# Altium schematic sheet RS485.SchDoc: RS485 Transceiver
size A4; ApprovedBy: LD Stanton; Author: LD Stanton; CompanyName: University of Cape Town; DrawnBy: Lawrence Stanton; Engineer: Lawrence Stanton; Organization: University of Cape Town; Address1: Department of Electrical Engineering; Address2: Rondebosch; Address3: Cape Town; Address4: South Africa 7701; DocumentNumber: 7; SheetNumber: 7; SheetTotal: 14
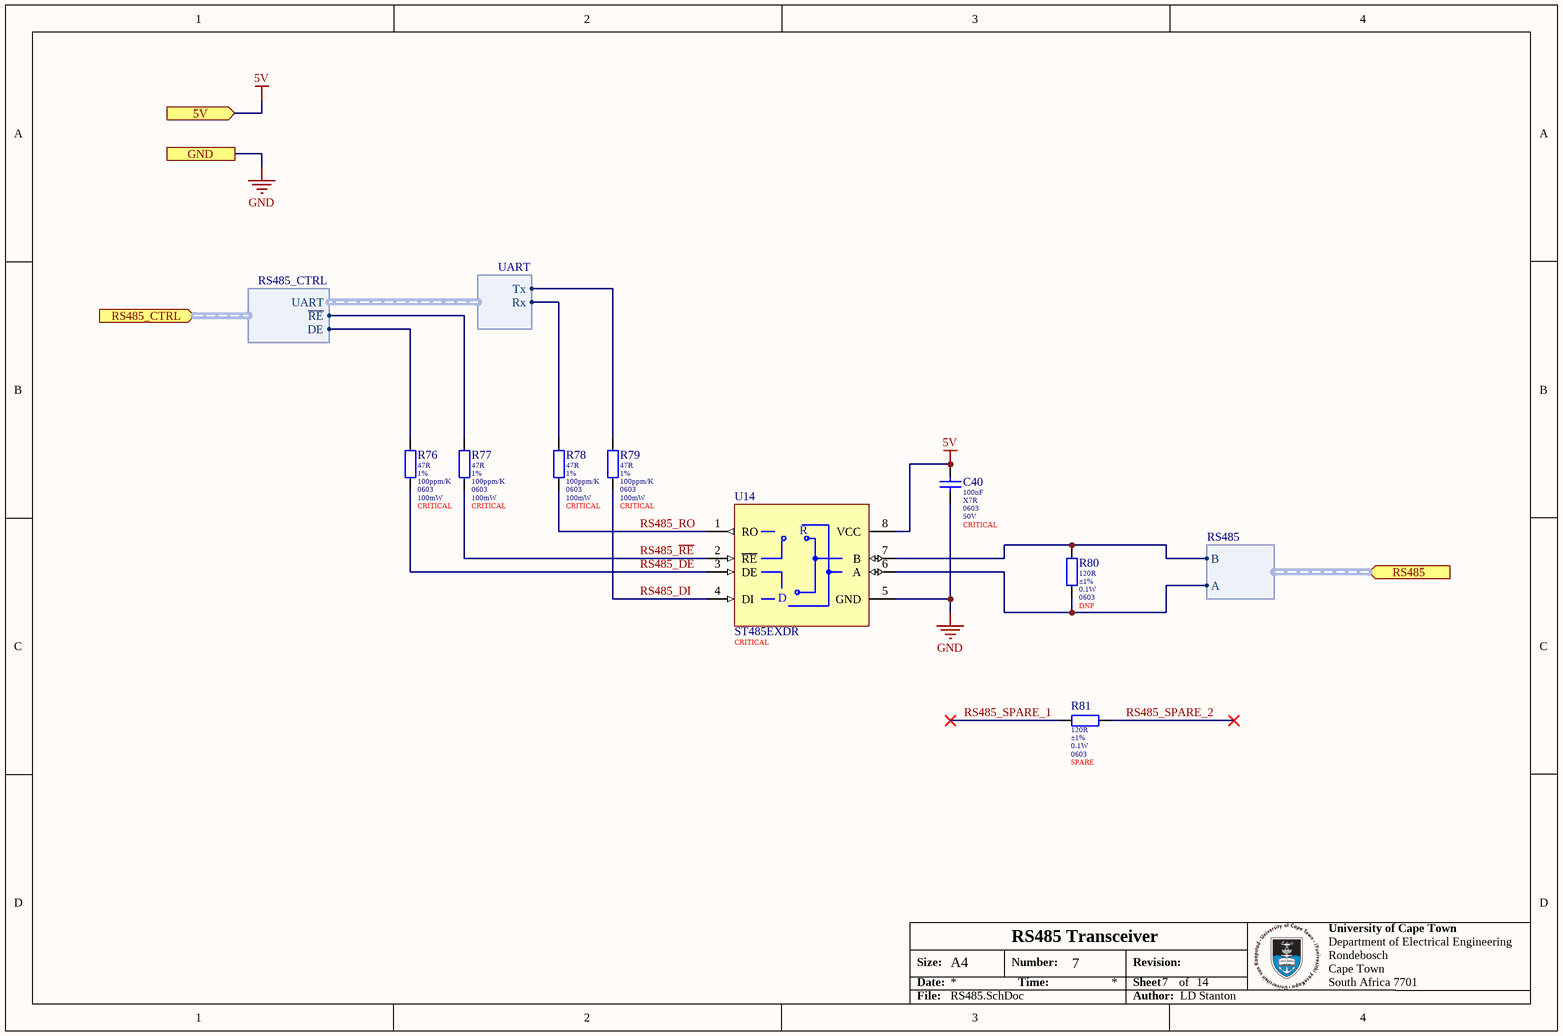
[diagram p0: RS485.SchDoc]

## Parts
C40  value 100nF  Dielectric: X7R  Package: 0603  Voltage: 50V  Populate: CRITICAL  [0603 (Yageo DA) B]  (hidden comment: CC0603KRX7R9BB104)
R76  value 47R  Tolerance: 1%  Temperature Coefficient: 100ppm/K  Package: 0603  Power: 100mW  Populate: CRITICAL  [0603 (Uniroyal) B]  (hidden comment: 0603WAF470JT5E)
R77  value 47R  Tolerance: 1%  Temperature Coefficient: 100ppm/K  Package: 0603  Power: 100mW  Populate: CRITICAL  [0603 (Uniroyal) B]  (hidden comment: 0603WAF470JT5E)
R78  value 47R  Tolerance: 1%  Temperature Coefficient: 100ppm/K  Package: 0603  Power: 100mW  Populate: CRITICAL  [0603 (Uniroyal) B]  (hidden comment: 0603WAF470JT5E)
R79  value 47R  Tolerance: 1%  Temperature Coefficient: 100ppm/K  Package: 0603  Power: 100mW  Populate: CRITICAL  [0603 (Uniroyal) B]  (hidden comment: 0603WAF470JT5E)
R80  value 120R  Tolerance: ±1%  Power: 0.1W  Package: 0603  Populate: DNP  [0603 (Uniroyal) B]  (hidden comment: 0603WAF1200T5E)
R81  value 120R  Tolerance: ±1%  Power: 0.1W  Package: 0603  Populate: SPARE  [0603 (Uniroyal) B]  (hidden comment: 0603WAF1200T5E)
U14  ST485EXDR  Placement: CRITICAL  [SO-8 (ST485E) B]

## Ports
5V (in), GND, RS485 (in, harness RS485), RS485_CTRL (in, harness RS485_CTRL)

## Harnesses
RS485: A, B
RS485_CTRL: UART, DE, ~{RE}
UART: Tx, Rx

## Nets
5V: C40.1 U14.8(VCC) ; port 5V
GND: C40.2 U14.5(GND) ; port GND
RS485_DE: R76.1 U14.3(DE)
RS485_DI: R79.1 U14.4(DI)
RS485_~{RE}: R77.1 U14.2(~{RE})
RS485_RO: R78.1 U14.1(RO)
RS485_SPARE_1: R81.1
RS485_SPARE_2: R81.2
NetR76_2: R76.2 ; port RS485_CTRL.DE
NetR77_2: R77.2 ; port RS485_CTRL.~{RE}
NetR78_2: R78.2 ; harness UART.Rx
NetR79_2: R79.2 ; harness UART.Tx
NetR80_1: R80.1 U14.7(B) ; port RS485.B
NetR80_2: R80.2 U14.6(A) ; port RS485.A

## Notes on the sheet
- Size:
- Date:
- A4
- Number:
- Time:
- Revision:
- Sheet
- of
- File:
- Author:
- (in symbol CMP-00141-1) R; D

## Library data of the parts
C40 = CMP-047-000000-9: MLCC 100nF 50V 0603 X7R ±10%; Manufacturer: Yageo; Tolerance: ±10%; ComponentLink1Description: Datasheet; ComponentLink1URL: https://datasheet.lcsc.com/szlcsc/YAGEO-CC0603KRX7R9BB104_C14663.pdf; LCSC Part Number: C14663
R76-R79 = CMP-00128-3: Resistor 47R 0603 ±1% Thick Film Uniroyal; Voltage Rating: 75V; ComponentLink1Description: Datasheet; Min Operating Temperature: -55°C; Manufacturer: Uniroyal; ComponentLink1URL: https://datasheet.lcsc.com/szlcsc/1811062009_UNI-ROYAL-Uniroyal-Elec-0603WAF1002T5E_C25804.pdf; Composition: Thick Film; LCSC Part Number: C23182; Max Operating Temperature: 155°C
R80 R81 = CMP-010-000300-9: Resistor 120R 0603 ±1% Thick Film Uniroyal; Working Voltage: 75V; Temperature Coefficient: ±100ppm/K; ComponentLink1URL: https://datasheet.lcsc.com/szlcsc/1811062009_UNI-ROYAL-Uniroyal-Elec-0603WAF1002T5E_C25804.pdf; Manufacturer: Uniroyal; LCSC Part Number: C22787; Pin Count: 2; ComponentLink1Description: Datasheet; Temperature: -55 - 155°C
U14 = CMP-00141-1: +/-15 kV ESD protected, low power RS-485/RS-422 transceiver, [-55oC, 125oC] temperature range; ComponentLink1URL: https://www.st.com/resource/en/datasheet/st485ex.pdf; Min Operating Temperature: -55°C; ComponentLink1Description: Datasheet; LCSC Part Number: C283496; Max Operating Temperature: 125°C